# Altium schematic sheet Node_nhan.SchDoc
size A; SheetNumber: 1; SheetTotal: 1
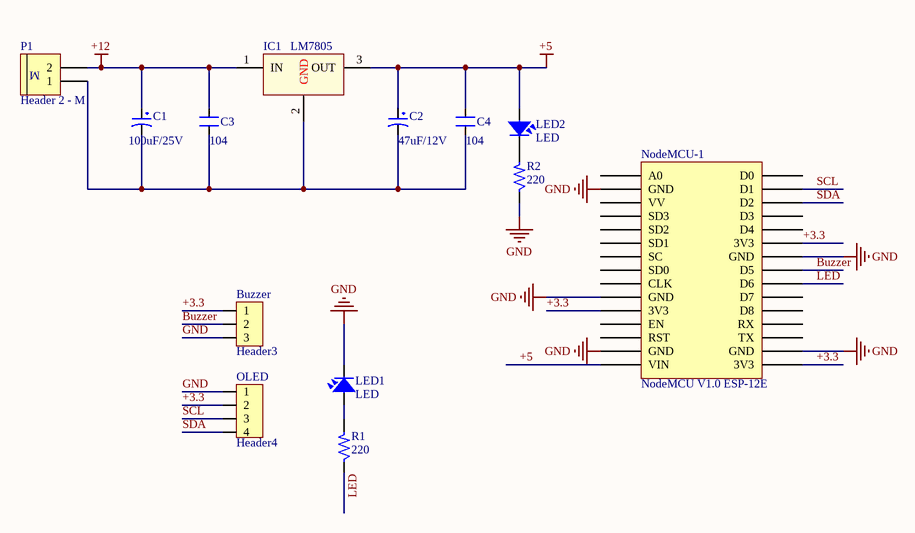
[diagram p0: Node_nhan.SchDoc]

## Parts
Buzzer  Header3  [HDR3]
C1  100uF/25V  [CP1.5/3.4]
C2  47uF/12V  [CP1.5/3.4]
C3  104  [CN1]
C4  104  [CN1]
IC1  LM7805  [QTO-220]
LED1  LED  [LED-3]
LED2  LED  [LED-3]
NodeMCU-1  NodeMCU V1.0 ESP-12E  [MODULE_ZC563900]
OLED  Header4  [HDR4]
P1  Header 2 - M  [Medium - Header 2]
R1  220  [R1/8W]
R2  220  [R1/8W]

## Nets
+5: C2.1 C4.1 IC1.3(OUT) LED2.1 NodeMCU-1.VIN
+12: C1.1 C3.1 IC1.1(IN) P1.2
GND: Buzzer.3 LED1.2 NodeMCU-1.GND OLED.1 R2.1
+3.3: Buzzer.1 NodeMCU-1.3V3 OLED.2
Buzzer: Buzzer.2 NodeMCU-1.D5
LED: NodeMCU-1.D6 R1.1
SCL: NodeMCU-1.D1 OLED.3
SDA: NodeMCU-1.D2 OLED.4
NetC1_2: C1.2 C2.2 C3.2 C4.2 IC1.2(GND) P1.1
NetLED1_1: LED1.1 R1.2
NetLED2_2: LED2.2 R2.2

Not connected (* = marked no-connect by the designer): NodeMCU-1 A0 CLK D0 D3 D4 D7 D8 EN RST RX SC SD0 SD1 SD2 SD3 TX VV

## Notes on the sheet
- (in symbol Header 2 - M) M

## Library data of the parts
Buzzer = Header3: Header IDC, 3 x 1 Pin Vertical 2.54mm Pitch (Non-Boxed, Male); Manufacturer: W¨¹rth Elektronik eiSos GmbH; partNo: 613002143121; ComponentLink1 Description: Manufacturer; ComponentLink2 Description: Datasheet; NoPins: 02; Created Date: 29 March 2013; ComponentLink1URL: http://www.we-online.com; ComponentLink2URL: http://katalog.we-online.de/em/datasheet/6130xx143121.pdf; Created by: Karrer Zheng
C1 C2 = CP3: Cap 100uF/35V - 470uF/16V; Value: 100uF/35V/50V; Description 1: 1000uF/6,3V - 470uF/16V - 330uF - 25V; Description 2: 220uF/35V - 100uF/50V - 63V - 4,7uF/200V; Description 3: 22uF => 33uF100V - 3,3uF => 4,7uF/250V; Description 4: 2,2uF =>3,3uF/350 - 2,2uF/400V - 1uF/450V
C3 C4 = CN1: Cap np  1pF - 472pF; Value: 100pF
IC1 = LM78xx: On ap +, from + 5 to + 24VDC; Value: LM7805
LED1 LED2 = LED: LED Single colour Green and Red; Value: LED 3 ly Single Colour
NodeMCU-1 = NodeMCU V1.0 ESP-12E: NodeMCU V1.0 ESP8266 (ESP-12E)
OLED = Header4: Header IDC, 4 x 1 Pin Vertical 2.54mm Pitch (Non-Boxed, Male); Manufacturer: W¨¹rth Elektronik eiSos GmbH; partNo: 613002143121; ComponentLink1 Description: Manufacturer; ComponentLink2 Description: Datasheet; NoPins: 02; Created Date: 29 March 2013; ComponentLink1URL: http://www.we-online.com; ComponentLink2URL: http://katalog.we-online.de/em/datasheet/6130xx143121.pdf; Created by: Karrer Zheng
P1 = Header 2 - M: Header, 2-Pin, Medium; LatestRevisionDate: 17-Jul-2002; LatestRevisionNote: Re-released for DXP Platform.; Publisher: Altium Limited
R1 R2 = R: Resistor 1/4W; Value: R1/4W - 1K